# Altium schematic sheet Power-Sheet.SchDoc
size 420 x 297 mm; SheetNumber: 2; SheetTotal: 4
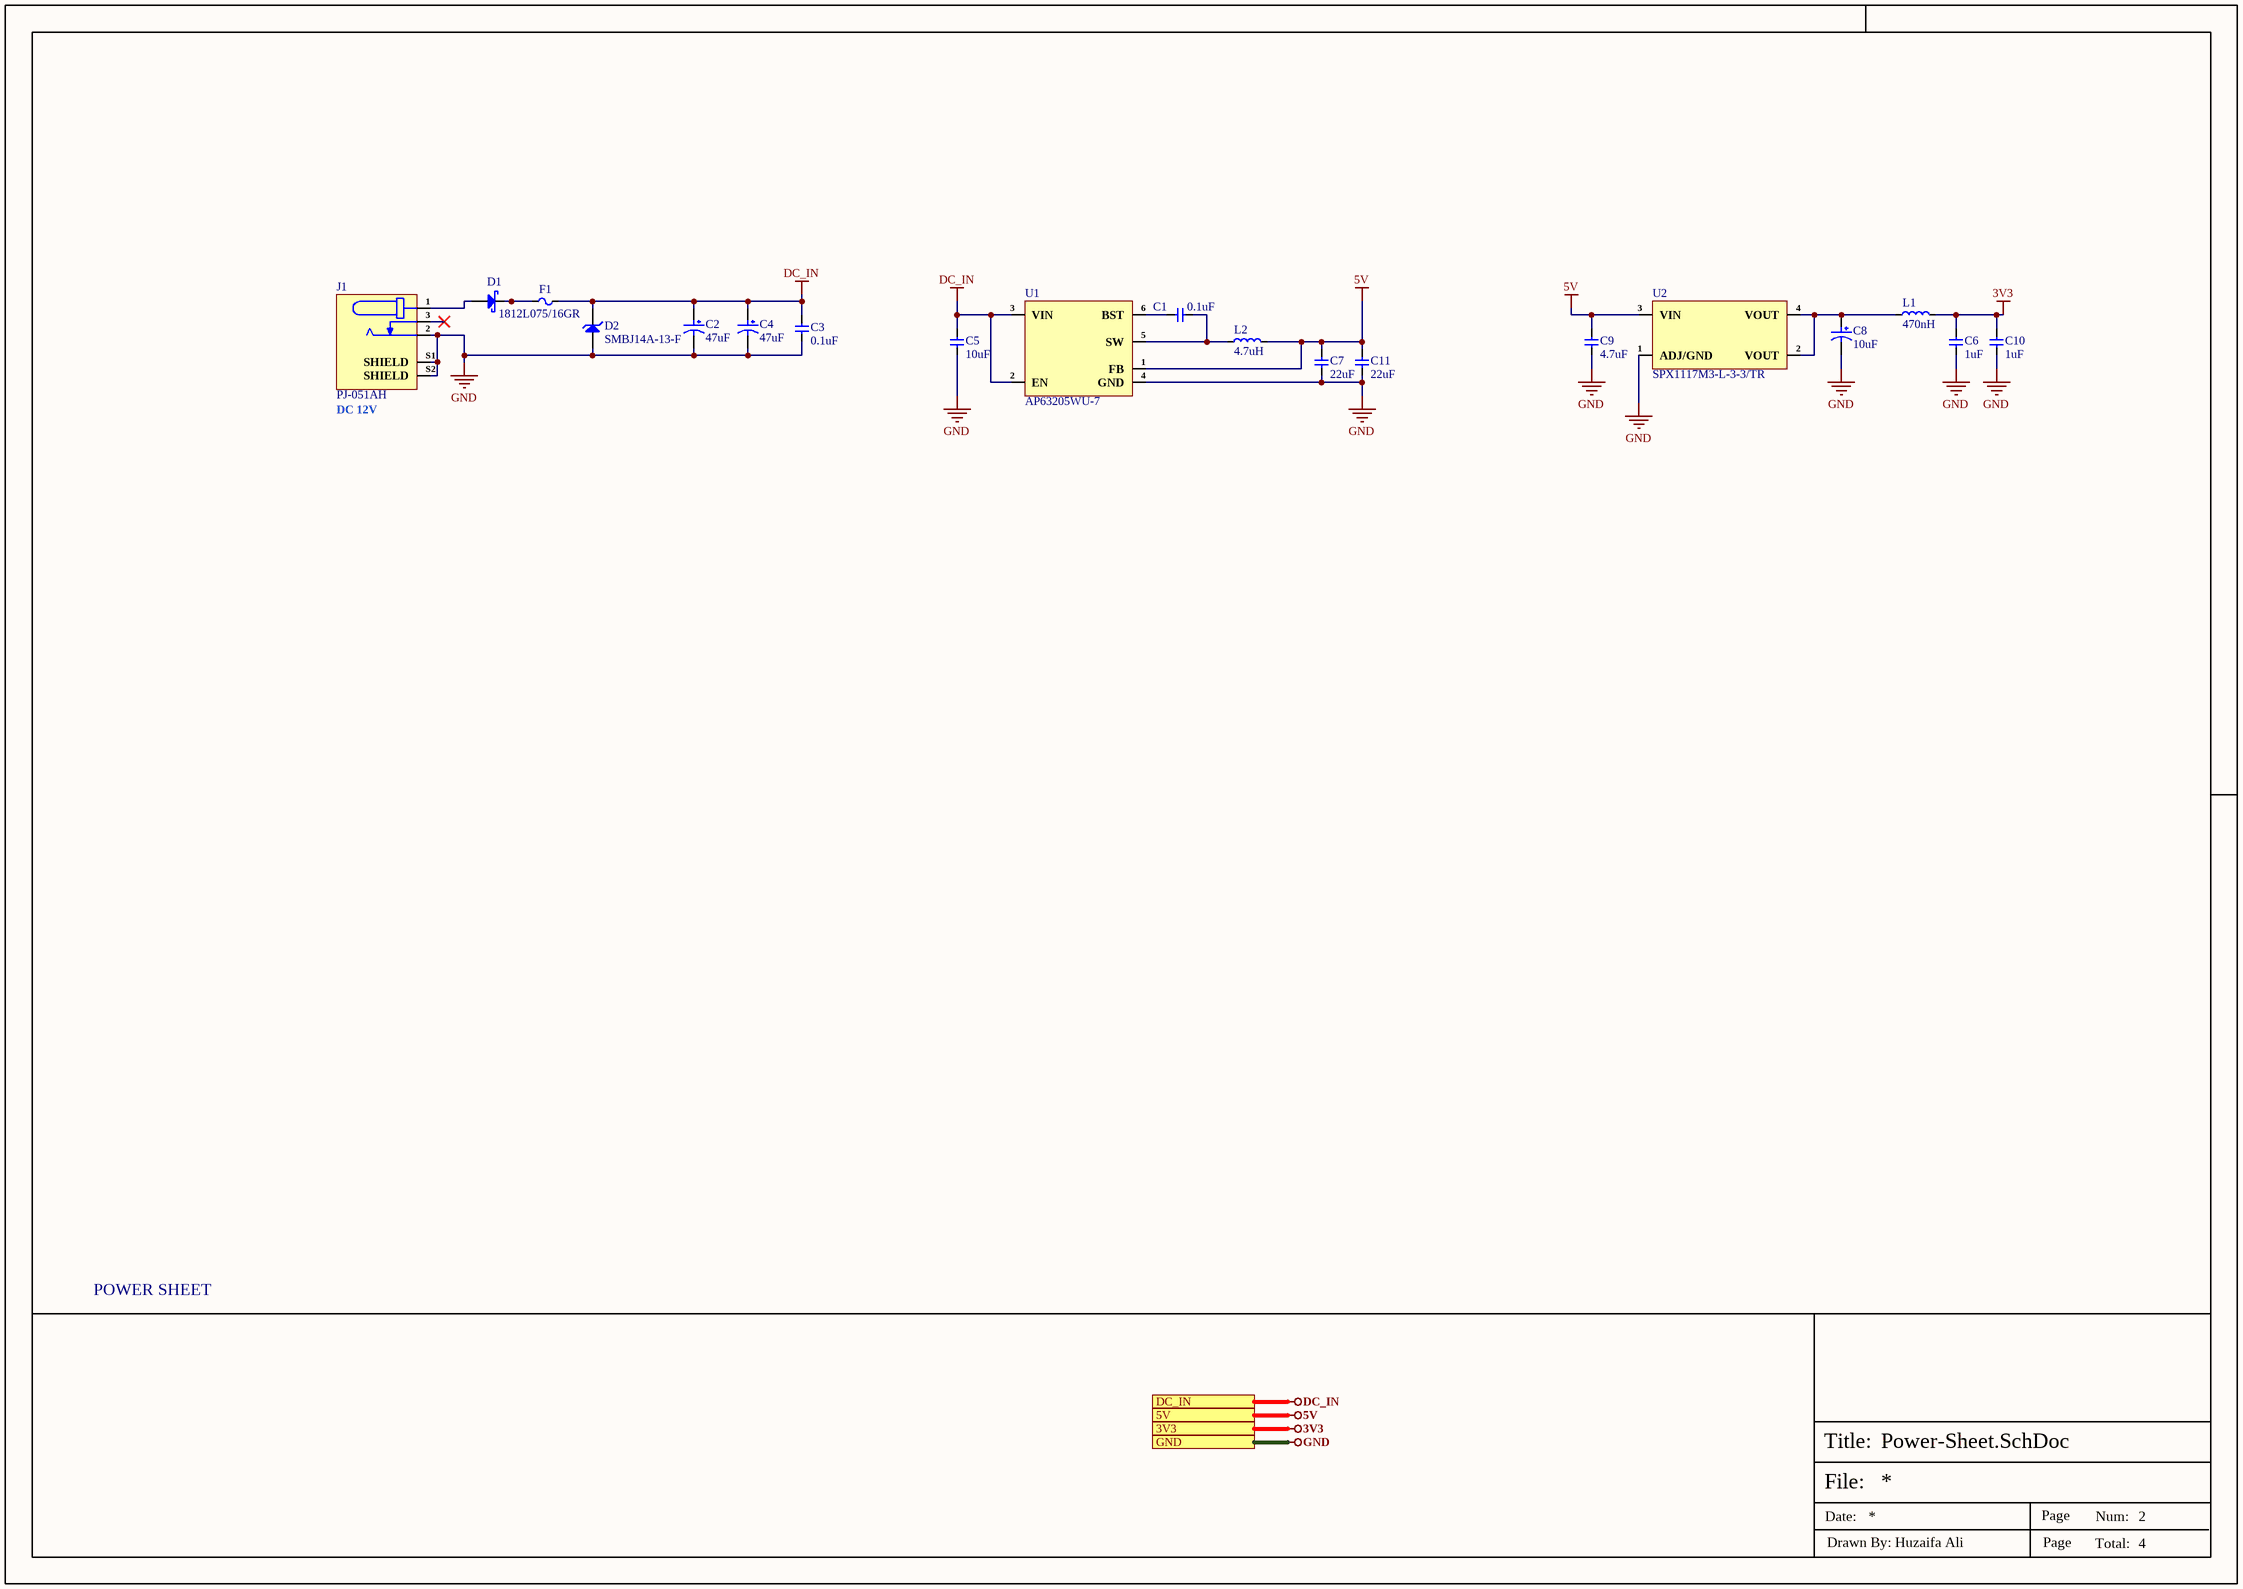
[diagram p0: Power-Sheet.SchDoc]

## Parts
C1  0.1uF  [Cap-0402]
C2  47uF  [RVT1H470M0607]
C3  0.1uF  [Cap-0402]
C4  47uF  [RVT1H470M0607]
C5  10uF  [Cap-1210]
C6  1uF  [Cap-0402]
C7  22uF  [Cap-0402]
C8  10uF  [EDK106M025A9BAA_]
C9  4.7uF  [Cap-0402]
C10  1uF  [Cap-0402]
C11  22uF  [Cap-0402]
D1  SS16  [SMA]  (value not drawn)
D2  SMBJ14A-13-F  [SMB_]
F1  1812L075/16GR  [1812-FUSE]
J1  PJ-051AH  [PJ-051AH]
L1  470nH  [IND-0806]
L2  4.7uH  [YPRH0703-4R7M]
U1  AP63205WU-7  [TSOT-23-6]
U2  SPX1117M3-L-3-3/TR  [SOT- 223]

## Ports
3V3 (see Top_Sheet[1B], Audio-Interface[5D], Controller-Sheet[2D]), 5V (see Top_Sheet[1A], Audio-Interface[5D]), DC_IN (see Top_Sheet[1A]), GND (see Top_Sheet[1B], Audio-Interface[5D], Controller-Sheet[2D])

## Nets
3V3: C6.2 C10.2 L1.2 ; port 3V3
5V: C7.2 C9.2 C11.2 L2.2 U1.1(FB) U2.3(VIN) ; port 5V
DC_IN: C2.1 C3.2 C4.1 C5.2 D2.2(K) F1.2 U1.2(EN) U1.3(VIN) ; port DC_IN
GND: C2.2 C3.1 C4.2 C5.1 C6.1 C7.1 C8.2 C9.1 C10.1 C11.1 D2.1(A) J1.2 J1.S1(SHIELD) J1.S2(SHIELD) U1.4(GND) U2.1(ADJ/GND) ; port GND
NetC1_1: C1.1 L2.1 U1.5(SW)
NetC1_2: C1.2 U1.6(BST)
NetC8_1: C8.1 L1.1 U2.2(VOUT) U2.4(VOUT)
NetD1_1: D1.1(K) F1.1
NetD1_2: D1.2(A) J1.1

Not connected (* = marked no-connect by the designer): J1 3*

## Notes on the sheet
- (near J1) DC 12V
- POWER SHEET
- File:
- Title:
- Date:
- Page
- Num:
- Total:
- Drawn By: Huzaifa Ali

## Library data of the parts
C1 = CL05B104KB54PNC: CAP CER 0.1UF 50V X7R 0402; Manufacturer: Samsung; Supplier 1: Digi-Key; Manufacturer Part Number: CL05B104KB54PNC; Stock 1: 8594; Pricing 1: 1=0.1, 10=0.067, 50=0.0366, 100=0.0299, 500=0.02138, 1000=0.01681, 2500=0.01528, 5000=0.01406 (USD); Supplier Part Number 1: 1276-CL05B104KB54PNCDKR-ND; LCSC Part Number: C307331
C2 C4 = RVT1H470M0607: 47uF 50V 66mA@120Hz ±20% SMD,D6.3xL7.7mm Aluminum Electrolytic Capacitors - SMD ROHS; Manufacturer: ROQANG; Manufacturer Part Number: RVT1H470M0607; Package: SMD,D6.3xL7.7mm; LCSC Part Number: C72523; Item Type: Capacitor; ComponentLink1Description: LCSC; ComponentLink1URL: https://www.lcsc.com/product-detail/Aluminum-Electrolytic-Capacitors-SMD_ROQANG-RVT1H470M0607_C72523.html
C3 = CC0402KRX7R8BB104: CAP CER 0.1UF 25V X7R 0402; Manufacturer: Yageo; Tolerance: 10%; Capacitance: 100nF; Dissipation Factor: 3.5%; Supplier 1: Digi-Key; Manufacturer Part Number: CC0402KRX7R8BB104; RoHS: Yes; Category: Ceramic Capacitors; Stock 1: 1841009; Pricing 1: 1=0.10000, 10=0.03100, 50=0.01700, 100=0.01390, 500=0.00990, 1000=0.00777, 2500=0.00707, 5000=0.00650 (USD); Mount: Surface Mount; Case/Package: 0402; Case Code (Imperial): 0402; Case Code (Metric): 1005; Min Operating Temperature: -55°C; Max Operating Temperature: 125°C; Dielectric: X7R; Voltage Rating: 25V; Voltage Rating (DC): 25V; Packaging: Tape and Reel; Termination: SMD/SMT; Resistor Type: Ceramic; Length: 1mm; Width: 0.02inch; Height: 0.5mm; Thickness: 0.022inch; Depth: 0.5mm; Radiation Hardening: No; Lead Free: Lead Free; Halogen Free: Halogen Free; ComponentLink1URL: https://datasheet.ciiva.com/11464/upy-gphc-x7r-6-3v-to-50v-8-11464889.pdf?src-supplier=Avnet; ComponentLink1Description: https://datasheet.ciiva.com/11464/upy-gphc-x7r-6-3v-to-50v-8-11464889.pdf?src-supplier=Avnet; ComponentLink2URL: https://datasheet.ciiva.com/13210/upy-gphc-x7r-6-3v-to-50v-8-12304-13210908.pdf?src-supplier=Mouser; ComponentLink2Description: https://datasheet.ciiva.com/13210/upy-gphc-x7r-6-3v-to-50v-8-12304-13210908.pdf?src-supplier=Mouser; ComponentLink3URL: https://datasheet.ciiva.com/17437/upy-gphc-x7r-6-3v-to-50v-8-17437357.pdf?src-supplier=Avnet+Europe; ComponentLink3Description: https://datasheet.ciiva.com/17437/upy-gphc-x7r-6-3v-to-50v-8-17437357.pdf?src-supplier=Avnet+Europe; Supplier Part Number 1: 311-2077-1-ND; LCSC Part Number: C105883
C5 = GRM32ER71J106KA12L: Multilayer Ceramic Capacitors MLCC - SMD/SMT 1210 10uF 63volts *Derate Voltage/Temp; Manufacturer: Murata; Supplier: Avnet; Supplier Part Number: GRM32ER71J106KA12L; Manufacturer Part Number: GRM32ER71J106KA12L; RoHS: Yes; Category: Ceramic Capacitors; Stock: 55000; Pricing: 1000=0.3451, 2000=0.33698, 4000=0.32886, 6000=0.32074, 8000=0.31262 (USD); ComponentLink1URL: http://www.mouser.com/ds/2/281/c02e-2905.pdf?src-supplier=Mouser; ComponentLink1Description: http://www.mouser.com/ds/2/281/c02e-2905.pdf?src-supplier=Mouser; ComponentLink2URL: http://www.farnell.com/datasheets/2079202.pdf?src-supplier=Farnell; ComponentLink2Description: http://www.farnell.com/datasheets/2079202.pdf?src-supplier=Farnell; ComponentLink3URL: http://search.murata.co.jp/Ceramy/image/img/A01X/G101/ENG/GRM32ER71J106KA12-01.pdf?src-supplier=Digi-Key; ComponentLink3Description: http://search.murata.co.jp/Ceramy/image/img/A01X/G101/ENG/GRM32ER71J106KA12-01.pdf?src-supplier=Digi-Key; ComponentLink4URL: https://datasheet.octopart.com/GRM32ER71J106KA12L-Murata-datasheet-22122223.pdf?src-supplier=Future+Electronics; ComponentLink4Description: https://datasheet.octopart.com/GRM32ER71J106KA12L-Murata-datasheet-22122223.pdf?src-supplier=Future+Electronics; ComponentLink5URL: http://psearch.en.murata.com/capacitor/product/GRM32ER71J106KA12%23.pdf?src-supplier=Avnet; ComponentLink5Description: http://psearch.en.murata.com/capacitor/product/GRM32ER71J106KA12%23.pdf?src-supplier=Avnet; ComponentLink6URL: http://www.farnell.com/datasheets/2079202.pdf?src-supplier=Newark; ComponentLink6Description: http://www.farnell.com/datasheets/2079202.pdf?src-supplier=Newark; ComponentLink7URL: http://www.farnell.com/datasheets/2079202.pdf?src-supplier=Element14; ComponentLink7Description: http://www.farnell.com/datasheets/2079202.pdf?src-supplier=Element14; Package: 1210; LCSC Part Number: C437568; Item Type: Capacitor; ComponentLink8Description: LCSC; ComponentLink8URL: https://www.lcsc.com/product-detail/Multilayer-Ceramic-Capacitors-MLCC-SMD-SMT_Murata-Electronics-GRM32ER71J106KA12L_C437568.html
C6 C10 = CC0402KRX5R7BB105: CAP CER 1UF 16V X5R 0402; Manufacturer: Yageo; Tolerance: 10%; Item Type: Capacitor; Supplier 1: Digi-Key; Manufacturer Part Number: CC0402KRX5R7BB105; Stock 1: 1405667; Pricing 1: 1=0.36, 10=0.252, 100=0.1512, 500=0.1134, 1000=0.09576, 2500=0.09072, 5000=0.08568 (USD); Mount: Surface Mount; Case/Package: 0402; Weight: 2.3E-05oz; Case Code (Imperial): 0402; Case Code (Metric): 1005; Min Operating Temperature: -55°C; Max Operating Temperature: 85°C; Capacitance: 1uF; Dielectric: X5R; Packaging: Tape and Reel; Voltage Rating (DC): 16V; Voltage Rating: 16V; Termination: SMD/SMT; Composition: Ceramic; Length: 1mm; Height: 0.5mm; Width: 0.02inch; Thickness: 0.022inch; Depth: 0.5mm; Radiation Hardening: No; Lead Free: Lead Free; Halogen Free: Halogen Free; ComponentLink1URL: http://www.yageo.com/documents/recent/UPY-GPHC_X5R_4V-to-50V_12.pdf?src-supplier=Avnet+Europe; ComponentLink1Description: http://www.yageo.com/documents/recent/UPY-GPHC_X5R_4V-to-50V_12.pdf?src-supplier=Avnet+Europe; Supplier Part Number 1: 311-1691-6-ND; LCSC Part Number: C325464
C7 C11 = GRM158R61A226ME15D: CAP CER 22UF 10V X5R 0402; Item Type: Capacitor; Material: 4241ConductorMaterial; Dielectric: 1537DielectricType; Tolerance: 20%; Supplier: Digi-Key; Supplier Part Number: 490-GRM158R61A226ME15DCT-ND; RoHS: Yes; Category: Ceramic Capacitors; Stock: 26634; Pricing: 1=0.45, 10=0.299, 50=0.2202, 100=0.1794, 500=0.1416, 1000=0.11957, 2500=0.11328 (USD); Case/Package: 343Case; Min Operating Temperature: -55°C; Max Operating Temperature: 85°C; Value: 22uF; Voltage Rating: 10V; Voltage Rating (DC): 10V; Length: 1mm; Width: 500um; Height: 800um; Thickness: 800um
C8 = EDK106M025A9BAA: CAP ALUM 10UF 20% 25V SMD; Manufacturer: KEMET; Dielectric Material: Aluminium; Ripple Current: 10mA; Life (Hours): 2000Hour; Leakage Current: 3uA; Dissipation Factor: 0.14%; Polarity: Polar; Lead Length: 1.8mm; Supplier 1: Digi-Key; Manufacturer Part Number: EDK106M025A9BAA; Stock 1: 9371; Pricing 1: 1=0.33, 10=0.225, 50=0.15, 100=0.1275, 500=0.08998, 1000=0.07873 (USD); Mount: Surface Mount,PCB; Case/Package: Radial; Min Operating Temperature: -40°C; Max Operating Temperature: 85°C; Package Quantity: 2000; Capacitance: 10uF; Voltage Rating: 25V; Tolerance: 20%; Packaging: Tape and Reel; Voltage Rating (DC): 25V; Termination: SMD/SMT; Series: EDK; Voltage: 25V; Diameter: 4mm; Length: 5.4mm; Height: 5.4mm; Height - Seated (Max): 0.217inch; Lead Pitch: 1mm; RoHS Compliant: Yes; REACH SVHC: No SVHC; ComponentLink1URL: https://api.kemet.com/component-edge/download/datasheet/EDK106M025A9BAA.pdf?src-supplier=Digi-Key; ComponentLink1Description: https://api.kemet.com/component-edge/download/datasheet/EDK106M025A9BAA.pdf?src-supplier=Digi-Key; ComponentLink2URL: https://www.alliedelec.com/m/d/48a492d9821943f3a399faec33a8c847.pdf?src-supplier=Allied+Electronics; ComponentLink2Description: https://www.alliedelec.com/m/d/48a492d9821943f3a399faec33a8c847.pdf?src-supplier=Allied+Electronics; ComponentLink3URL: http://www.mouser.com/ds/2/212/KEM_A4001_EDK-535350.pdf?src-supplier=Mouser; ComponentLink3Description: http://www.mouser.com/ds/2/212/KEM_A4001_EDK-535350.pdf?src-supplier=Mouser; Supplier Part Number 1: 399-6048-1-ND; LCSC Part Number: C1984940
C9 = CC0402KRX5R6BB475: CAP CER 4.7UF 10V X5R 0402; Manufacturer: Yageo; Tolerance: 10%; Supplier 1: Farnell; Manufacturer Part Number: CC0402KRX5R6BB475; RoHS: Yes; Category: Ceramic Capacitors; Stock 1: 20000; Pricing 1: 10000=0.02310, 50000=0.02100 (GBP); Mount: Surface Mount; Case/Package: 0402; Case Code (Imperial): 0402; Case Code (Metric): 1005; Min Operating Temperature: -55°C; Max Operating Temperature: 85°C; Packaging: Cut Tape; Capacitance: 4.7uF; Voltage Rating: 10V; RoHS Compliant: Yes; ComponentLink1URL: http://www.yageo.com/documents/recent/UPY-GPHC_X5R_4V-to-50V_25.pdf?src-supplier=Digi-Key; ComponentLink1Description: http://www.yageo.com/documents/recent/UPY-GPHC_X5R_4V-to-50V_25.pdf?src-supplier=Digi-Key; Supplier Part Number 1: 3871698; LCSC Part Number: C326586
D1 = SS16: 60V 700mV@1A 1A SMA(DO-214AC) Schottky Barrier Diodes (SBD) ROHS; Manufacturer: MDD; Item Type: Schottky Diode; Manufacturer Part Number: SS16; Package: SMA(DO-214AC); LCSC Part Number: C2481; ComponentLink1Description: LCSC; ComponentLink1URL: https://www.lcsc.com/product-detail/Schottky-Barrier-Diodes-SBD_MDD-Microdiode-Electronics-SS16_C2481.html
D2 = SMBJ14A-13-F: TVS DIODE 14VWM 23.2VC SMB; Manufacturer: Diodes; Direction: Unidirectional; Reverse Breakdown Voltage: 15.6V; Max Surge Current: 25.8A; Reverse Standoff Voltage: 14V; Clamping Voltage: 23.2V; Max Power Dissipation: 600W; Number of Elements: 1; Test Current: 1mA; Max Reverse Leakage Current: 5uA; Max Breakdown Voltage: 17.9V; Forward Voltage: 5V; Value: 1nF; Number of Channels: 1NUMBER; Supplier: Digikey; Supplier Part Number: SMBJ14A-FDICT-ND; Manufacturer Part Number: SMBJ14A-13-F; RoHS: Yes; Category: TVS Diodes; Stock: 21112; Pricing: 1=0.43, 10=0.305, 100=0.1538, 500=0.13628, 1000=0.10605 (USD); Mounting Technology: Surface Mount; Case/Package: SMB; Pins: 2; Min Operating Temperature: -55°C; Max Operating Temperature: 150°C; Packaging: Tape and Reel; Package Quantity: 1; Polarity: Unidirectional; Termination: SMD/SMT; Working Voltage: 14V; Breakdown Voltage: 15.6V; Peak Pulse Current: 25.8A; Peak Pulse Power: 600W; Min Breakdown Voltage: 15.6V; Power Dissipation: 600W; Leakage Current: 5uA; Voltage Rating (DC): 14V; Max Output current: 25.8A; Series: SMBJ; Clamping Voltage-Max: 23.2V; Length: 4.57mm; Width: 3.9mm; Height: 2.62mm; Radiation Hardening: No; Lead Free: Lead Free; RoHS Compliant: Yes; ComponentLink1URL: https://datasheet.ciiva.com/15143/getdatasheetpartid-91658-15143394.pdf?src-supplier=Verical; ComponentLink1Description: https://datasheet.ciiva.com/15143/getdatasheetpartid-91658-15143394.pdf?src-supplier=Verical; ComponentLink2URL: https://datasheet.ciiva.com/16487/ds19002-16487576.pdf?src-supplier=Future+Electronics; ComponentLink2Description: https://datasheet.ciiva.com/16487/ds19002-16487576.pdf?src-supplier=Future+Electronics; Item Type: Diode
F1 = 1812L075/16GR: 16V 750mA 1.5A 1812 Resettable Fuses ROHS; Manufacturer: LUTE; Manufacturer Part Number: 1812L075/16GR; Package: 1812; LCSC Part Number: C19078721; Item Type: Fuses; ComponentLink1Description: LCSC; ComponentLink1URL: https://www.lcsc.com/product-detail/Resettable-Fuses_LUTE-1812L075-16GR_C19078721.html
J1 = PJ-051AH: CONN PWR JACK 2X5.5MM SOLDER; Manufacturer: CUI Devices; Item Type: Power Connectors; Supplier: Digikey; LCSC Part Number: C22359773; Manufacturer Part Number: PJ-051AH; RoHS: Yes; Stock: 42904; Pricing: 1=1.1, 10=0.839, 25=0.754, 50=0.6964, 100=0.6438, 250=0.58156, 500=0.53948, 1000=0.50126, 2500=0.45618 (USD); ComponentLink1URL: https://www.cuidevices.com/product/resource/digikeypdf/pj-051ah.pdf?src-supplier=Digikey; ComponentLink1Description: https://www.cuidevices.com/product/resource/digikeypdf/pj-051ah.pdf?src-supplier=Digikey; ComponentLink2URL: https://datasheet.octopart.com/PJ-051AH-CUI-Devices-datasheet-137760691.pdf?src-supplier=Future+Electronics; ComponentLink2Description: https://datasheet.octopart.com/PJ-051AH-CUI-Devices-datasheet-137760691.pdf?src-supplier=Future+Electronics; ComponentLink3URL: https://datasheet.octopart.com/PJ-051AH-CUI-Devices-datasheet-141000361.pdf?src-supplier=Master+Electronics; ComponentLink3Description: https://datasheet.octopart.com/PJ-051AH-CUI-Devices-datasheet-141000361.pdf?src-supplier=Master+Electronics
L1 = 1286AS-H-R47M=P2: FIXED IND 470NH 3.4A 52 MOHM SMD; Manufacturer: Murata; Core Material: Ferrite; Shielding: Shielded; DC Resistance (DCR): 52mR; Test Frequency: 1MHz; Max DC Current: 3.8A; Tolerance: 20%; Item Type: Inductor; Supplier: Digi-Key; Supplier Part Number: 490-10606-1-ND; Manufacturer Part Number: 1286AS-H-R47M=P2; RoHS: Yes; Category: Fixed Inductors; Stock: 12493; Pricing: 1=0.39, 10=0.348, 25=0.3048, 50=0.2612, 100=0.2394, 250=0.21764, 500=0.2046, 1000=0.15671 (USD); Mounting Technology: Surface Mount; Case/Package: 0806; Case Code (Metric): 2016; Case Code (Imperial): 0806; Min Operating Temperature: -40°C; Max Operating Temperature: 85°C; Value: 470nH; Packaging: Cut Tape; Current Rating: 3.4A; Series: DFE201612C; Length: 0.079inch; Width: 0.063inch; Height - Seated (Max): 0.047inch; Depth: 1.6mm; RoHS Compliant: Yes; ComponentLink1URL: http://www.farnell.com/datasheets/2021974.pdf?src-supplier=Farnell; ComponentLink1Description: http://www.farnell.com/datasheets/2021974.pdf?src-supplier=Farnell; ComponentLink2URL: http://www.toko.co.jp/products/pdf/inductors/dfe201612c.pdf?src-supplier=Avnet; ComponentLink2Description: http://www.toko.co.jp/products/pdf/inductors/dfe201612c.pdf?src-supplier=Avnet; ComponentLink3URL: http://search.murata.co.jp/Ceramy/image/img/P02/J(E)TE243A-0010_DFE201612C_reference.pdf?src-supplier=Digi-Key; ComponentLink3Description: http://search.murata.co.jp/Ceramy/image/img/P02/J(E)TE243A-0010_DFE201612C_reference.pdf?src-supplier=Digi-Key; ComponentLink4URL: http://www.toko.co.jp/products/pdf/inductors/dfe201612c.pdf?src-supplier=Digi-Key; ComponentLink4Description: http://www.toko.co.jp/products/pdf/inductors/dfe201612c.pdf?src-supplier=Digi-Key; LCSC Part Number: C160957
L2 = YPRH0703-4R7M: 2.26A 4.7uH ±20% SMD,7.3x7.3mm Power Inductors ROHS; Manufacturer: YJYCOIN; Manufacturer Part Number: YPRH0703-4R7M; Package: SMD,7.3x7.3mm; LCSC Part Number: C338836; Item type: Inductor; ComponentLink1Description: LCSC; ComponentLink1URL: https://www.lcsc.com/product-detail/Power-Inductors_YJYCOIN-YPRH0703-4R7M_C338836.html
U1 = AP63205WU-7: IC REG BUCK 5V 2A TSOT26; Manufacturer: Diodes; Supplier 1: Digi-Key; Manufacturer Part Number: AP63205WU-7; RoHS: Yes; Category: Voltage Regulators - Switching; Stock 1: 88525; Pricing 1: 1=0.88, 10=0.776, 25=0.7292, 100=0.5952, 250=0.55284, 500=0.4705, 1000=0.3764 (USD); Supplier Part Number 1: AP63205WU-7DICT-ND; LCSC Part Number: C2071056; Item Type: IC
U2 = SPX1117M3-L-3-3/TR: IC REG LINEAR 3.3V 800MA SOT223; Manufacturer: MaxLinear; Number of Outputs: 1NUMBER; Max Supply Voltage: 20V; Nominal Supply Current: 5mA; Supplier: Digikey; LCSC Part Number: C6862; Manufacturer Part Number: SPX1117M3-L-3-3/TR; RoHS: Yes; Item Type: IC; Stock: 42701; Pricing: 1=0.68, 10=0.422, 25=0.3516, 100=0.2712, 250=0.2316, 500=0.20734, 1000=0.18707 (USD); Output Voltage: 3.3V; Number of Channels: 1NUMBER; Height: 1.8mm; ComponentLink1URL: https://datasheet.octopart.com/SPX1117M3-L-3-3-TR-MaxLinear-datasheet-11629451.pdf?src-supplier=Element14; ComponentLink1Description: https://datasheet.octopart.com/SPX1117M3-L-3-3-TR-MaxLinear-datasheet-11629451.pdf?src-supplier=Element14; ComponentLink2URL: https://www.exar.com/content/document.ashx?id=694&src-supplier=Digikey; ComponentLink2Description: https://www.exar.com/content/document.ashx?id=694&src-supplier=Digikey; ComponentLink3URL: https://datasheet.octopart.com/SPX1117M3-L-3-3-TR-MaxLinear-datasheet-133511130.pdf?src-supplier=TME; ComponentLink3Description: https://datasheet.octopart.com/SPX1117M3-L-3-3-TR-MaxLinear-datasheet-133511130.pdf?src-supplier=TME